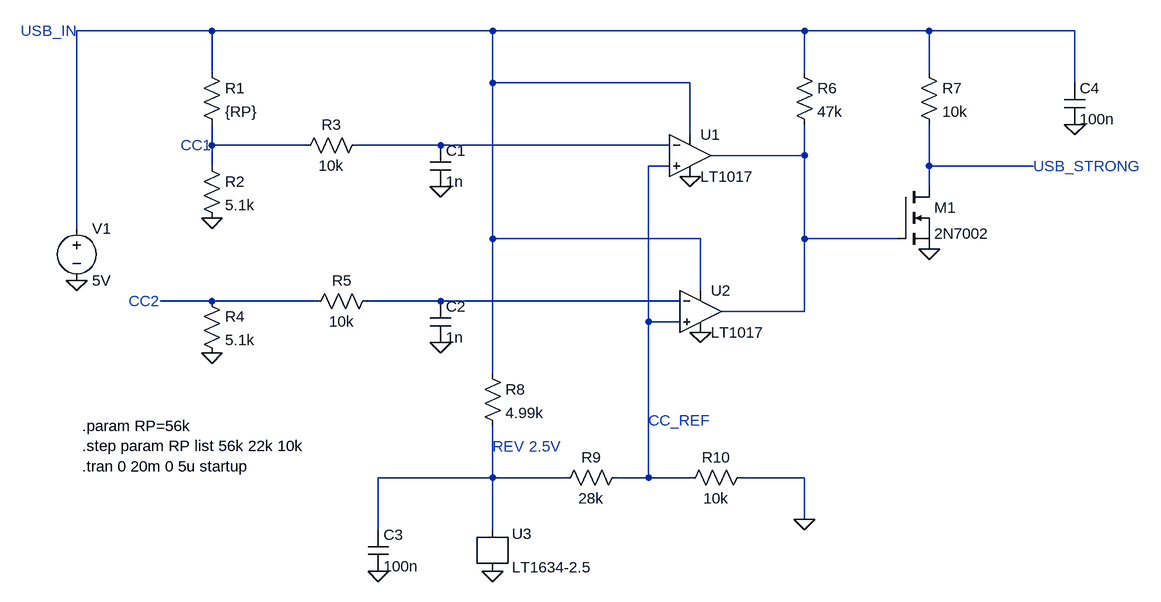
[diagram p0: schematic UBS_C 5V INPUT.asc]
UBS_C 5V INPUT.asc, the LTspice schematic file:
Version 4.1
SHEET 1 880 836
WIRE -720 -16 -928 -16
WIRE -288 -16 -720 -16
WIRE 192 -16 -288 -16
WIRE 384 -16 192 -16
WIRE 608 -16 384 -16
WIRE -720 48 -720 -16
WIRE 192 48 192 -16
WIRE 384 48 384 -16
WIRE -288 64 -288 -16
WIRE 16 64 -288 64
WIRE 608 64 608 -16
WIRE 16 144 16 64
WIRE -720 160 -720 128
WIRE -576 160 -720 160
WIRE -368 160 -496 160
WIRE -16 160 -368 160
WIRE 192 176 192 128
WIRE 192 176 48 176
WIRE -720 192 -720 160
WIRE -16 192 -48 192
WIRE 384 192 384 128
WIRE 544 192 384 192
WIRE 384 224 384 192
WIRE -928 288 -928 -16
WIRE -288 304 -288 64
WIRE 32 304 -288 304
WIRE 192 304 192 176
WIRE 336 304 192 304
WIRE 32 384 32 304
WIRE -720 400 -800 400
WIRE -560 400 -720 400
WIRE -368 400 -480 400
WIRE 0 400 -368 400
WIRE 192 416 192 304
WIRE 192 416 64 416
WIRE -48 432 -48 192
WIRE 0 432 -48 432
WIRE -288 512 -288 304
WIRE -288 672 -288 592
WIRE -288 672 -464 672
WIRE -176 672 -288 672
WIRE -48 672 -48 432
WIRE -48 672 -96 672
WIRE 16 672 -48 672
WIRE 192 672 96 672
WIRE 192 736 192 672
WIRE -464 752 -464 672
WIRE -288 752 -288 672
FLAG 16 208 0
FLAG -368 224 0
FLAG -720 272 0
FLAG -720 480 0
FLAG 32 448 0
FLAG 384 320 0
FLAG -368 464 0
FLAG -288 816 0
FLAG -928 368 0
FLAG 192 736 0
FLAG -464 816 0
FLAG 608 128 0
SYMBOL Comparators\\LT1017 16 176 R0
SYMATTR InstName U1
SYMBOL Comparators\\LT1017 32 416 R0
SYMATTR InstName U2
SYMBOL References\\LT1634-2.5 -288 784 R0
SYMATTR InstName U3
SYMBOL cap -384 160 R0
SYMATTR InstName C1
SYMATTR Value 1n
SYMBOL cap -384 400 R0
SYMATTR InstName C2
SYMATTR Value 1n
SYMBOL voltage -928 272 R0
SYMATTR InstName V1
SYMATTR Value 5V
SYMBOL res -736 32 R0
SYMATTR InstName R1
SYMATTR Value {RP}
SYMBOL res -736 176 R0
SYMATTR InstName R2
SYMATTR Value 5.1k
SYMBOL res -480 144 R90
WINDOW 0 0 56 VBottom 2
WINDOW 3 32 56 VTop 2
SYMATTR InstName R3
SYMATTR Value 10k
SYMBOL res -736 384 R0
SYMATTR InstName R4
SYMATTR Value 5.1k
SYMBOL res -464 384 R90
WINDOW 0 0 56 VBottom 2
WINDOW 3 32 56 VTop 2
SYMATTR InstName R5
SYMATTR Value 10k
SYMBOL res 176 32 R0
SYMATTR InstName R6
SYMATTR Value 47k
SYMBOL nmos 336 224 R0
SYMATTR InstName M1
SYMATTR Value 2N7002
SYMBOL res 368 32 R0
SYMATTR InstName R7
SYMATTR Value 10k
SYMBOL res -304 496 R0
SYMATTR InstName R8
SYMATTR Value 4.99k
SYMBOL res -80 656 R90
WINDOW 0 0 56 VBottom 2
WINDOW 3 32 56 VTop 2
SYMATTR InstName R9
SYMATTR Value 28k
SYMBOL res 112 656 R90
WINDOW 0 0 56 VBottom 2
WINDOW 3 32 56 VTop 2
SYMATTR InstName R10
SYMATTR Value 10k
SYMBOL cap -480 752 R0
SYMATTR InstName C3
SYMATTR Value 100n
SYMBOL cap 592 64 R0
SYMATTR InstName C4
SYMATTR Value 100n
TEXT -920 592 Left 2 !.param RP=56k\n.step param RP list 56k 22k 10k\n.tran 0 20m 0 5u startup
TEXT 544 192 Left 2 ;USB_STRONG
TEXT -720 160 Right 2 ;CC1
TEXT -800 400 Right 2 ;CC2
TEXT -928 -16 Right 2 ;USB_IN
TEXT -288 624 Left 2 ;REV 2.5V
TEXT -48 584 Left 2 ;CC_REF

The netlist it stands for:
* UBS_C 5V INPUT.asc
X§U1 N005 N003 N001 0 N004 LT1017  ; pins In+ In- V+ V- OUT
X§U2 N005 N008 N001 0 N004 LT1017  ; pins In+ In- V+ V- OUT
X§U3 N009 0 LT1634-2.5
C1 N003 0 1n
C2 N008 0 1n
V1 N001 0 5V
R1 N001 N002 {RP}
R2 N002 0 5.1k
R3 N003 N002 10k
R4 N007 0 5.1k
R5 N008 N007 10k
R6 N001 N004 47k
M1 N006 N004 0 0 2N7002
R7 N001 N006 10k
R8 N001 N009 4.99k
R9 N005 N009 28k
R10 0 N005 10k
C3 N009 0 100n
C4 N001 0 100n
.model NMOS NMOS
.model PMOS PMOS
.lib standard.mos
.param RP=56k
.step param RP list 56k 22k 10k
.tran 0 20m 0 5u startup
* USB_STRONG
* CC1
* CC2
* USB_IN
* REV 2.5V
* CC_REF
.backanno
.end